# Altium schematic sheet Terminal drag.SchDoc
size E
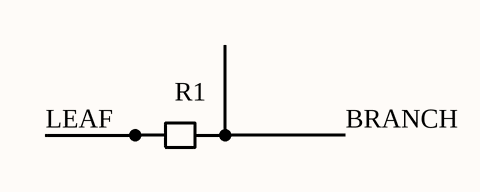
[diagram p0: Terminal drag.SchDoc]

## Parts
R1  (no value)

## Nets
BRANCH: R1.2
LEAF: R1.1

## Library data of the parts
R1 = TEST RESISTOR